# Altium schematic sheet IDC_Tester_v1_LED_4.SchDoc
size 420 x 297 mm; SheetNumber: 6; SheetTotal: 9
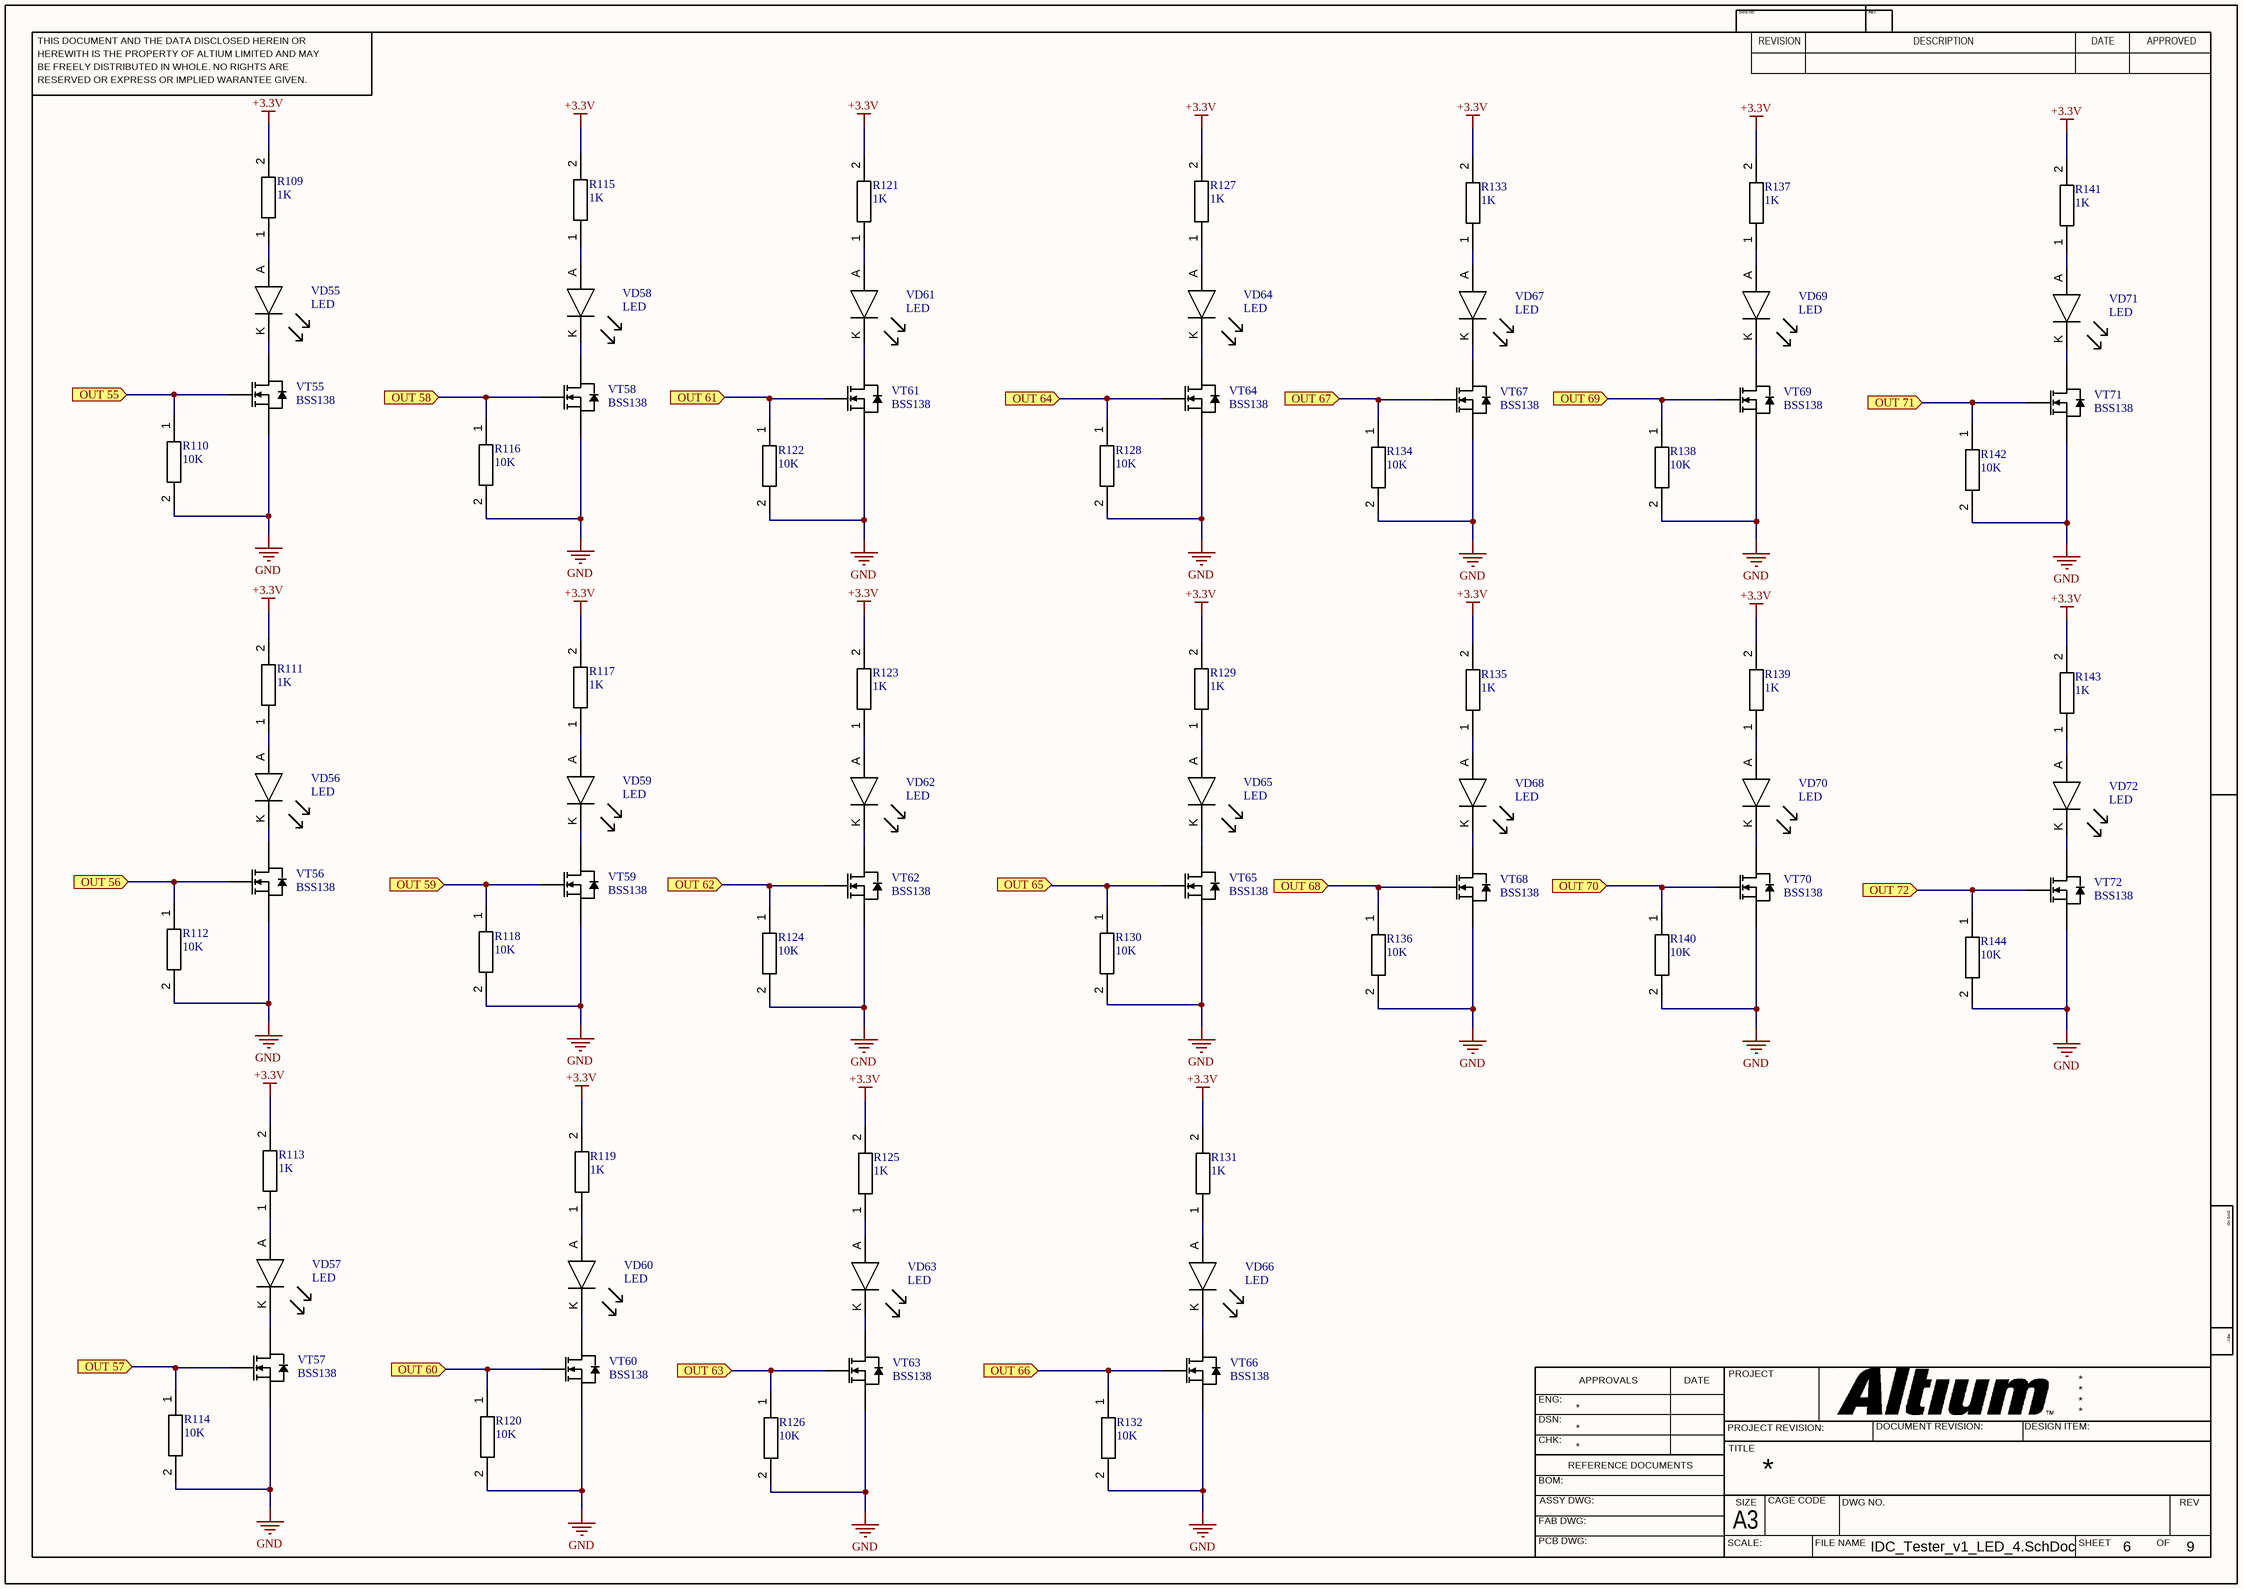
[diagram p0: IDC_Tester_v1_LED_4.SchDoc]

## Parts
R109  1K  [Resistor 0603]
R110  10K  [Resistor 0603]
R111  1K  [Resistor 0603]
R112  10K  [Resistor 0603]
R113  1K  [Resistor 0603]
R114  10K  [Resistor 0603]
R115  1K  [Resistor 0603]
R116  10K  [Resistor 0603]
R117  1K  [Resistor 0603]
R118  10K  [Resistor 0603]
R119  1K  [Resistor 0603]
R120  10K  [Resistor 0603]
R121  1K  [Resistor 0603]
R122  10K  [Resistor 0603]
R123  1K  [Resistor 0603]
R124  10K  [Resistor 0603]
R125  1K  [Resistor 0603]
R126  10K  [Resistor 0603]
R127  1K  [Resistor 0603]
R128  10K  [Resistor 0603]
R129  1K  [Resistor 0603]
R130  10K  [Resistor 0603]
R131  1K  [Resistor 0603]
R132  10K  [Resistor 0603]
R133  1K  [Resistor 0603]
R134  10K  [Resistor 0603]
R135  1K  [Resistor 0603]
R136  10K  [Resistor 0603]
R137  1K  [Resistor 0603]
R138  10K  [Resistor 0603]
R139  1K  [Resistor 0603]
R140  10K  [Resistor 0603]
R141  1K  [Resistor 0603]
R142  10K  [Resistor 0603]
R143  1K  [Resistor 0603]
R144  10K  [Resistor 0603]
VD55  LED  [Led 0603 - duplicate]
VD56  LED  [Led 0603 - duplicate]
VD57  LED  [Led 0603 - duplicate]
VD58  LED  [Led 0603 - duplicate]
VD59  LED  [Led 0603 - duplicate]
VD60  LED  [Led 0603 - duplicate]
VD61  LED  [Led 0603 - duplicate]
VD62  LED  [Led 0603 - duplicate]
VD63  LED  [Led 0603 - duplicate]
VD64  LED  [Led 0603 - duplicate]
VD65  LED  [Led 0603 - duplicate]
VD66  LED  [Led 0603 - duplicate]
VD67  LED  [Led 0603 - duplicate]
VD68  LED  [Led 0603 - duplicate]
VD69  LED  [Led 0603 - duplicate]
VD70  LED  [Led 0603 - duplicate]
VD71  LED  [Led 0603 - duplicate]
VD72  LED  [Led 0603 - duplicate]
VT55  BSS138  [SOT-23-3]
VT56  BSS138  [SOT-23-3]
VT57  BSS138  [SOT-23-3]
VT58  BSS138  [SOT-23-3]
VT59  BSS138  [SOT-23-3]
VT60  BSS138  [SOT-23-3]
VT61  BSS138  [SOT-23-3]
VT62  BSS138  [SOT-23-3]
VT63  BSS138  [SOT-23-3]
VT64  BSS138  [SOT-23-3]
VT65  BSS138  [SOT-23-3]
VT66  BSS138  [SOT-23-3]
VT67  BSS138  [SOT-23-3]
VT68  BSS138  [SOT-23-3]
VT69  BSS138  [SOT-23-3]
VT70  BSS138  [SOT-23-3]
VT71  BSS138  [SOT-23-3]
VT72  BSS138  [SOT-23-3]

## Ports
OUT 55 (in), OUT 56 (in), OUT 57 (in), OUT 58 (in), OUT 59 (in), OUT 60 (in), OUT 61 (in), OUT 62 (in), OUT 63 (in), OUT 64 (in), OUT 65 (in), OUT 66 (in), OUT 67 (in), OUT 68 (in), OUT 69 (in), OUT 70 (in), OUT 71 (in), OUT 72 (in)

## Nets
+3.3V: R109.2 R111.2 R113.2 R115.2 R117.2 R119.2 R121.2 R123.2 R125.2 R127.2 R129.2 R131.2 R133.2 R135.2 R137.2 R139.2 R141.2 R143.2
GND: R110.2 R112.2 R114.2 R116.2 R118.2 R120.2 R122.2 R124.2 R126.2 R128.2 R130.2 R132.2 R134.2 R136.2 R138.2 R140.2 R142.2 R144.2 VT55.2(S) VT56.2(S) VT57.2(S) VT58.2(S) VT59.2(S) VT60.2(S) VT61.2(S) VT62.2(S) VT63.2(S) VT64.2(S) VT65.2(S) VT66.2(S) VT67.2(S) VT68.2(S) VT69.2(S) VT70.2(S) VT71.2(S) VT72.2(S)
OUT 55: R110.1 VT55.1(G) ; port OUT 55
OUT 56: R112.1 VT56.1(G) ; port OUT 56
OUT 57: R114.1 VT57.1(G) ; port OUT 57
OUT 58: R116.1 VT58.1(G) ; port OUT 58
OUT 59: R118.1 VT59.1(G) ; port OUT 59
OUT 60: R120.1 VT60.1(G) ; port OUT 60
OUT 61: R122.1 VT61.1(G) ; port OUT 61
OUT 62: R124.1 VT62.1(G) ; port OUT 62
OUT 63: R126.1 VT63.1(G) ; port OUT 63
OUT 64: R128.1 VT64.1(G) ; port OUT 64
OUT 65: R130.1 VT65.1(G) ; port OUT 65
OUT 66: R132.1 VT66.1(G) ; port OUT 66
OUT 67: R134.1 VT67.1(G) ; port OUT 67
OUT 68: R136.1 VT68.1(G) ; port OUT 68
OUT 69: R138.1 VT69.1(G) ; port OUT 69
OUT 70: R140.1 VT70.1(G) ; port OUT 70
OUT 71: R142.1 VT71.1(G) ; port OUT 71
OUT 72: R144.1 VT72.1(G) ; port OUT 72
NetR109_1: R109.1 VD55.A
NetR111_1: R111.1 VD56.A
NetR113_1: R113.1 VD57.A
NetR115_1: R115.1 VD58.A
NetR117_1: R117.1 VD59.A
NetR119_1: R119.1 VD60.A
NetR121_1: R121.1 VD61.A
NetR123_1: R123.1 VD62.A
NetR125_1: R125.1 VD63.A
NetR127_1: R127.1 VD64.A
NetR129_1: R129.1 VD65.A
NetR131_1: R131.1 VD66.A
NetR133_1: R133.1 VD67.A
NetR135_1: R135.1 VD68.A
NetR137_1: R137.1 VD69.A
NetR139_1: R139.1 VD70.A
NetR141_1: R141.1 VD71.A
NetR143_1: R143.1 VD72.A
NetVD55_K: VD55.K VT55.3(D)
NetVD56_K: VD56.K VT56.3(D)
NetVD57_K: VD57.K VT57.3(D)
NetVD58_K: VD58.K VT58.3(D)
NetVD59_K: VD59.K VT59.3(D)
NetVD60_K: VD60.K VT60.3(D)
NetVD61_K: VD61.K VT61.3(D)
NetVD62_K: VD62.K VT62.3(D)
NetVD63_K: VD63.K VT63.3(D)
NetVD64_K: VD64.K VT64.3(D)
NetVD65_K: VD65.K VT65.3(D)
NetVD66_K: VD66.K VT66.3(D)
NetVD67_K: VD67.K VT67.3(D)
NetVD68_K: VD68.K VT68.3(D)
NetVD69_K: VD69.K VT69.3(D)
NetVD70_K: VD70.K VT70.3(D)
NetVD71_K: VD71.K VT71.3(D)
NetVD72_K: VD72.K VT72.3(D)

## Notes on the sheet
- THIS DOCUMENT AND THE DATA DISCLOSED HEREIN OR
- HEREWITH IS THE PROPERTY OF ALTIUM LIMITED AND MAY
- DWG NO:
- REVISION
- REV:
- DESCRIPTION
- DATE
- APPROVED
- BE FREELY DISTRIBUTED IN WHOLE. NO RIGHTS ARE
- RESERVED OR EXPRESS OR IMPLIED WARANTEE GIVEN.
- ENG:
- APPROVALS
- PROJECT
- DSN:
- CHK:
- REFERENCE DOCUMENTS
- PROJECT REVISION:
- TITLE
- DOCUMENT REVISION:
- DESIGN ITEM:
- BOM:
- FAB DWG:
- PCB DWG:
- ASSY DWG:
- SCALE:
- A3
- SIZE
- CAGE CODE
- FILE NAME
- DWG NO.
- SHEET
- OF
- REV

## Library data of the parts
R109 R111 R113 R115 R117 R119 R121 R123 R125 R127 R129 R131 R133 R135 R137 R139 R141 R143 = Resistor 1K: Part Number: SMD RES 1K OHM 1%±100ppm/°C 0603 (RMCF0603FT1K00); Added by: viskov2055@gmail.com; Mount_Type: SMD; Solder_Amount: 2; Pkg: 0603; Created at: 13/02/2024; Mount: MOUNT
R110 R112 R114 R116 R118 R120 R122 R124 R126 R128 R130 R132 R134 R136 R138 R140 R142 R144 = Resistor 10K: Part Number: SMD RES 10K OHM 1%±100ppm/°C 0603 (RMCF0603FT10K0); Added by: viskov2055@gmail.com; Mount_Type: SMD; Solder_Amount: 2; Pkg: 0603; Created at: 15/02/2024; Mount: MOUNT
VD55-VD72 = LED: LED Uni-Color Green 515nm 2-Pin SMD T/R; Manufacturer: Kingbright; Manufacturer Part Number: APG1608ZGCK; Lens Style: Flat; Lens Transparency: Clear; Luminous Intensity: 400mcd; Forward Voltage: 3.3V; Test Current: 20mA; Viewing Angle: 130°; Dominant Wavelength: 525nm; Lens Size: 0.8mm; Added by: viskov2055@gmail.com; Solder_Amount: 2; Pkg: 0603; RoHS: Yes; Category: LEDs; Stock 1: 44996; Pricing 1: 1=0,6, 10=0,368, 100=0,2114, 1000=0,16544, 2000=0,15165 (USD); MountType: SMD; Case/Package: 0603; Color: Green; Case Code (Imperial): 0603; Case Code (Metric): 1608; Packaging: Tape and Reel; Length: 1.6mm; Width: 0.8mm; Height: 0.28mm; RoHS Compliant: Yes; ComponentLink1URL: https://datasheet.octopart.com/APG1608ZGCK-Kingbright-datasheet-153682089.pdf?src-supplier=Future+Electronics; ComponentLink1Description: https://datasheet.octopart.com/APG1608ZGCK-Kingbright-datasheet-153682089.pdf?src-supplier=Future+Electronics; ComponentLink2URL: http://www.kingbrightusa.com/images/catalog/SPEC/APG1608ZGCK.pdf?src-supplier=Digikey; ComponentLink2Description: http://www.kingbrightusa.com/images/catalog/SPEC/APG1608ZGCK.pdf?src-supplier=Digikey; ComponentLink3URL: https://datasheet.octopart.com/APG1608ZGCK-Kingbright-datasheet-137408059.pdf?src-supplier=Sager+Electronics; ComponentLink3Description: https://datasheet.octopart.com/APG1608ZGCK-Kingbright-datasheet-137408059.pdf?src-supplier=Sager+Electronics; Supplier Part Number 1: 754-2113-1-ND; Created at: 13/02/2024; Mount: MOUNT; Part Number: APG1608ZGCK; Supplier 1: Digikey
VT55-VT72 = BSS138: N-Channel Logic Level Enhancement Mode Field Effect Transistor; Solder_Amount: 3; Added_by: ma_lubushkin@teslatec.ru; Pkg: SOT-23; Part Number: BSS138; Mount: MOUNT; MountType: SMD; Created_at: 03/12/2019